# Altium project ODOS_PDB_5V.PrjPcb
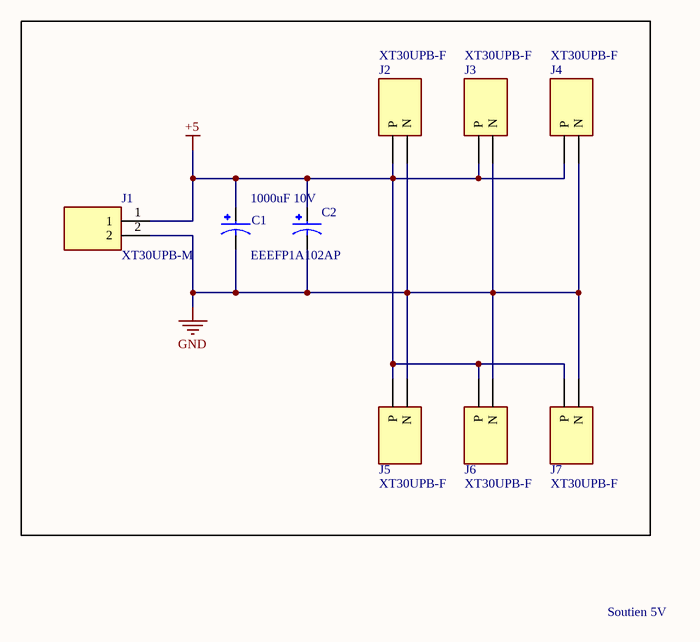
[diagram p0: ODOS_PDB_5V_schem.SchDoc]
1 sheet, 9 parts. Net scope: global (net labels, ports and power ports of the same name join across sheets).
Board file: ODOS_PDB_5V_pcb.PcbDoc

## Sheet ODOS_PDB_5V_schem.SchDoc
size A4; SheetNumber: 1; SheetTotal: 1

### Parts
C1  1000uF 10V  [CAP_EEEFP1A102AP]
C2  EEEFP1A102AP  [CAP_EEEFP1A102AP]
J1  XT30UPB-M  [AMASS_XT30UPB-M]
J2  XT30UPB-F  [XT30UPBF]
J3  XT30UPB-F  [XT30UPBF]
J4  XT30UPB-F  [XT30UPBF]
J5  XT30UPB-F  [XT30UPBF]
J6  XT30UPB-F  [XT30UPBF]
J7  XT30UPB-F  [XT30UPBF]

### Nets
+5: C1.1 C2.1 J1.1 J2.1(P) J3.1(P) J4.1(P) J5.1(P) J6.1(P) J7.1(P)
GND: C1.2 C2.2 J1.2 J2.2(N) J3.2(N) J4.2(N) J5.2(N) J6.2(N) J7.2(N)

### Notes on the sheet
- Soutien 5V

### Library data of the parts
C1 C2 = EEEFP1A102AP: Cap Aluminum 1000uF 10V 20% (10 X 10.2mm) SMD 0.06 Ohm 1190mA 2000 hr 105Â°C Embossed T/R; MF: Panasonic; Purchase-URL: https://pricing.snapeda.com/search/part/EEEFP1A102AP/?ref=eda; Value: *; Package: RADIAL-2 Panasonic; Check_prices: https://www.snapeda.com/parts/EEEFP1A102AP/Panasonic/view-part/?ref=eda; Digi-Key_Part_Number: PCE4434CT-ND; MP: EEEFP1A102AP; SnapEDA_Link: https://www.snapeda.com/parts/EEEFP1A102AP/Panasonic/view-part/?ref=snap
J1 = XT30UPB-M: Connector; Manufacturer_Name: Amass; Datasheet Link: https://www.tme.eu/Document/4acc913878197f8c2e30d4b8cdc47230/XT30UPB%20SPEC.pdf; Height: 10.7mm; Manufacturer_Part_Number: XT30UPB-M
J2-J7 = XT30UPB-F: Connector; Manufacturer_Name: Amass; Datasheet Link: https://www.tme.eu/Document/81f11ca924696756331f21b972812074/XT30PB-F.pdf; Height: 9.4mm; Manufacturer_Part_Number: XT30UPB-F